# Altium project Bananna board.PrjPcb
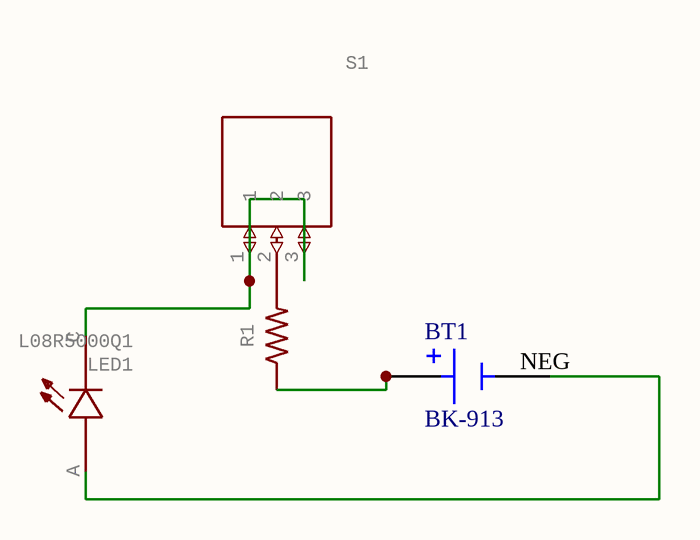
[diagram p0: Bananna board.SchDoc]
1 sheet, 4 parts. Net scope: global (net labels, ports and power ports of the same name join across sheets).
Board file: Bananna board.PcbDoc

## Sheet Bananna board.SchDoc
size 79 x 73 mm; Origin: Eagle; OriginPath: C:\Users\Nate\Documents\GitHub\PCbs\US iLab Led Driver\Bananna board.sch; OriginSheet: 1

### Parts
BT1  BK-913  [BAT_BK-913]
LED1  L08R5000Q1  [LEDRD254W57D500H1070]
R1  (no value)  [0207/12]
S1  (no value)  [OS102011MA1QN1]

### Nets
NetBT1_NEG: BT1.NEG LED1.A
NetBT1_S+1: BT1.S+1(POS) BT1.S+2(POS) R1.1
NetLED1_C: LED1.C S1.1 S1.3
NetR1_2: R1.2 S1.2

### Library data of the parts
BT1 = BK-913: Battery Retainer Coin, 20.0mm 1 Cell PC Pin; MF: MPD; SnapEDA_Link: https://www.snapeda.com/parts/BK-913/Memory+Protection+Devices/view-part/?ref=snap; Package: Non-Standard MPD; Value: *; MP: BK-913; Check_prices: https://www.snapeda.com/parts/BK-913/Memory+Protection+Devices/view-part/?ref=eda
LED1 = L08R5000Q1: LED, Orange, Through Hole, T-1 3/4 (5mm), 30 mA, 2.1 V, 635 nm  Check availability; GateName_1: G$1; MF: LED Technology; SymbolName_1: L08R5000Q1; LibraryName: L08R5000Q1; DeviceSetName: L08R5000Q1; AVAILABILITY: In Stock; MP: L08R5000Q1; PACKAGE: None; PRICE: None
R1 = R-US_0207/12: RESISTOR, American symbol; GateName_1: G$1; SymbolName_1: R-US; DeviceSetName: R-US_; DeviceName: 0207/12; LibraryName: resistor
S1 = OS102011MA1QN1: Switch Slide Right Angle SPDT 0.1A 12VDC Through Hole Slide Switch SPDT On-On 0.1 A@ 12 V dc Slide   Source:  Datasheet; MANUFACTURER_NAME: C & K COMPONENTS; GateName_1: G$1; SymbolName_1: OS102011MA1QN1; LibraryName: OS102011MA1QN1; DeviceSetName: OS102011MA1QN1; HEIGHT: mm; MANUFACTURER_PART_NUMBER: OS102011MA1QN1; MOUSER_PART_NUMBER: 611-OS102011MA1QN1; MOUSER_PRICE-STOCK: https://www.mouser.co.uk/ProductDetail/CK/OS102011MA1QN1?qs=WtljUlYws5R6MUgHcLkz4w%3D%3D